# Altium project a4403-ELE-CAD.PrjPcb (part 1 of 4)
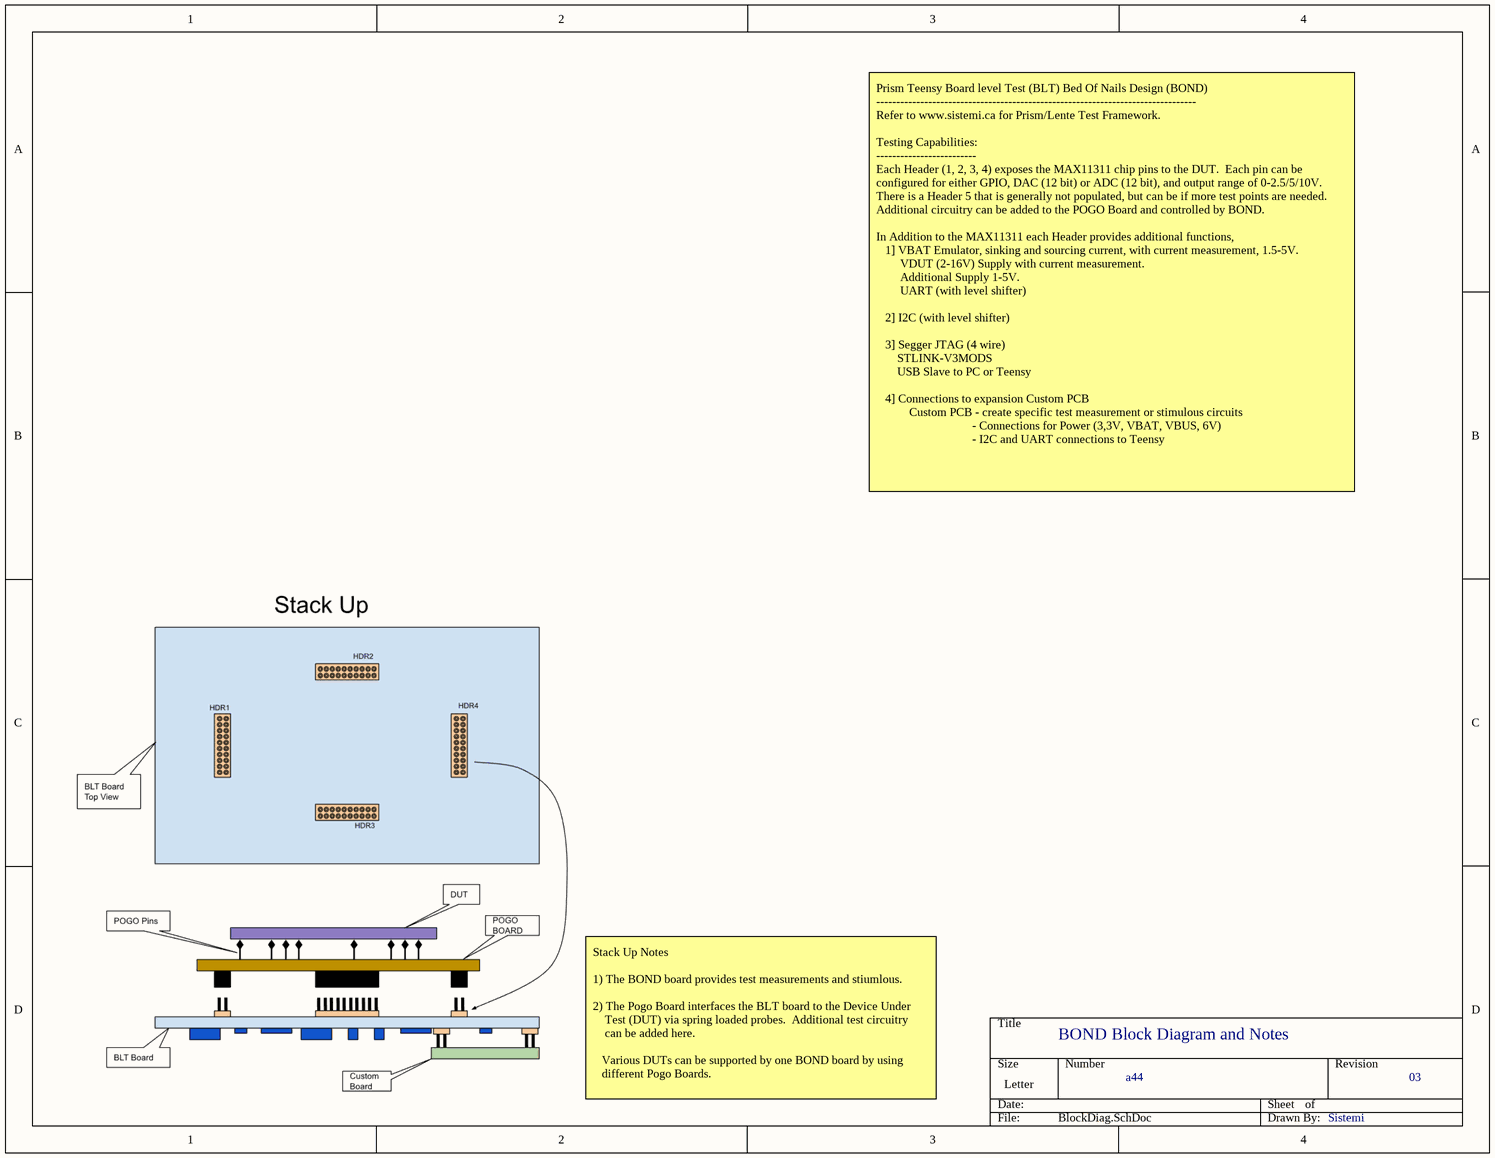
[diagram p0: BlockDiag.SchDoc]
15 sheets, 389 parts. Net scope: hierarchical (ports join the sheet entries above them; power ports are global).
Board file: a4403-ELE_PCB.PcbDoc
Sheets:
  BlockDiag.SchDoc
  Top.SchDoc
    SH2 = VBAT.SchDoc
    SH4 = Hdr1.SchDoc
    SH5 = Hdr2.SchDoc
    SH6 = Hdr3.SchDoc
      Designator = stlink.SchDoc
    SH7 = Hdr4.SchDoc
    SH8 = JigInterface.SchDoc
    SH9 = PowerDist.SchDoc
    SH10 = VDUT.SchDoc
    SH11 = Teensy4.SchDoc
    SH12 = SMPS.SchDoc
    SH13 = IOExpand.SchDoc
    SH14 = Hdr5.SchDoc

## Sheet BlockDiag.SchDoc
size Letter; SheetNumber: 1; SheetTotal: 15

### Notes on the sheet
- Prism Teensy Board level Test (BLT) Bed Of Nails Design (BOND)
  --------------------------------------------------------------------------------
  Refer to www.sistemi.ca for Prism/Lente Test Framework.
  Testing Capabilities:
  -------------------------
  Each Header (1, 2, 3, 4) exposes the MAX11311 chip pins to the DUT.  Each pin can be
  configured for either GPIO, DAC (12 bit) or ADC (12 bit), and output range of 0-2.5/5/10V.
  There is a Header 5 that is generally not populated, but can be if more test points are needed.
  Additional circuitry can be added to the POGO Board and controlled by BOND.
  In Addition to the MAX11311 each Header provides additional functions,
  1] VBAT Emulator, sinking and sourcing current, with current measurement, 1.5-5V.
  VDUT (2-16V) Supply with current measurement.
  Additional Supply 1-5V.
  UART (with level shifter)
  2] I2C (with level shifter)
  3] Segger JTAG (4 wire)
  STLINK-V3MODS
  USB Slave to PC or Teensy
  4] Connections to expansion Custom PCB
  Custom PCB - create specific test measurement or stimulous circuits
  - Connections for Power (3,3V, VBAT, VBUS, 6V)
  - I2C and UART connections to Teensy
- BOND Block Diagram and Notes
- Stack Up Notes
  1) The BOND board provides test measurements and stiumlous.
  2) The Pogo Board interfaces the BLT board to the Device Under
  Test (DUT) via spring loaded probes.  Additional test circuitry
  can be added here.
  Various DUTs can be supported by one BOND board by using
  different Pogo Boards.
- a44
- 03
- Sistemi

## Sheet Top.SchDoc
size Letter; SheetNumber: 2; SheetTotal: 15
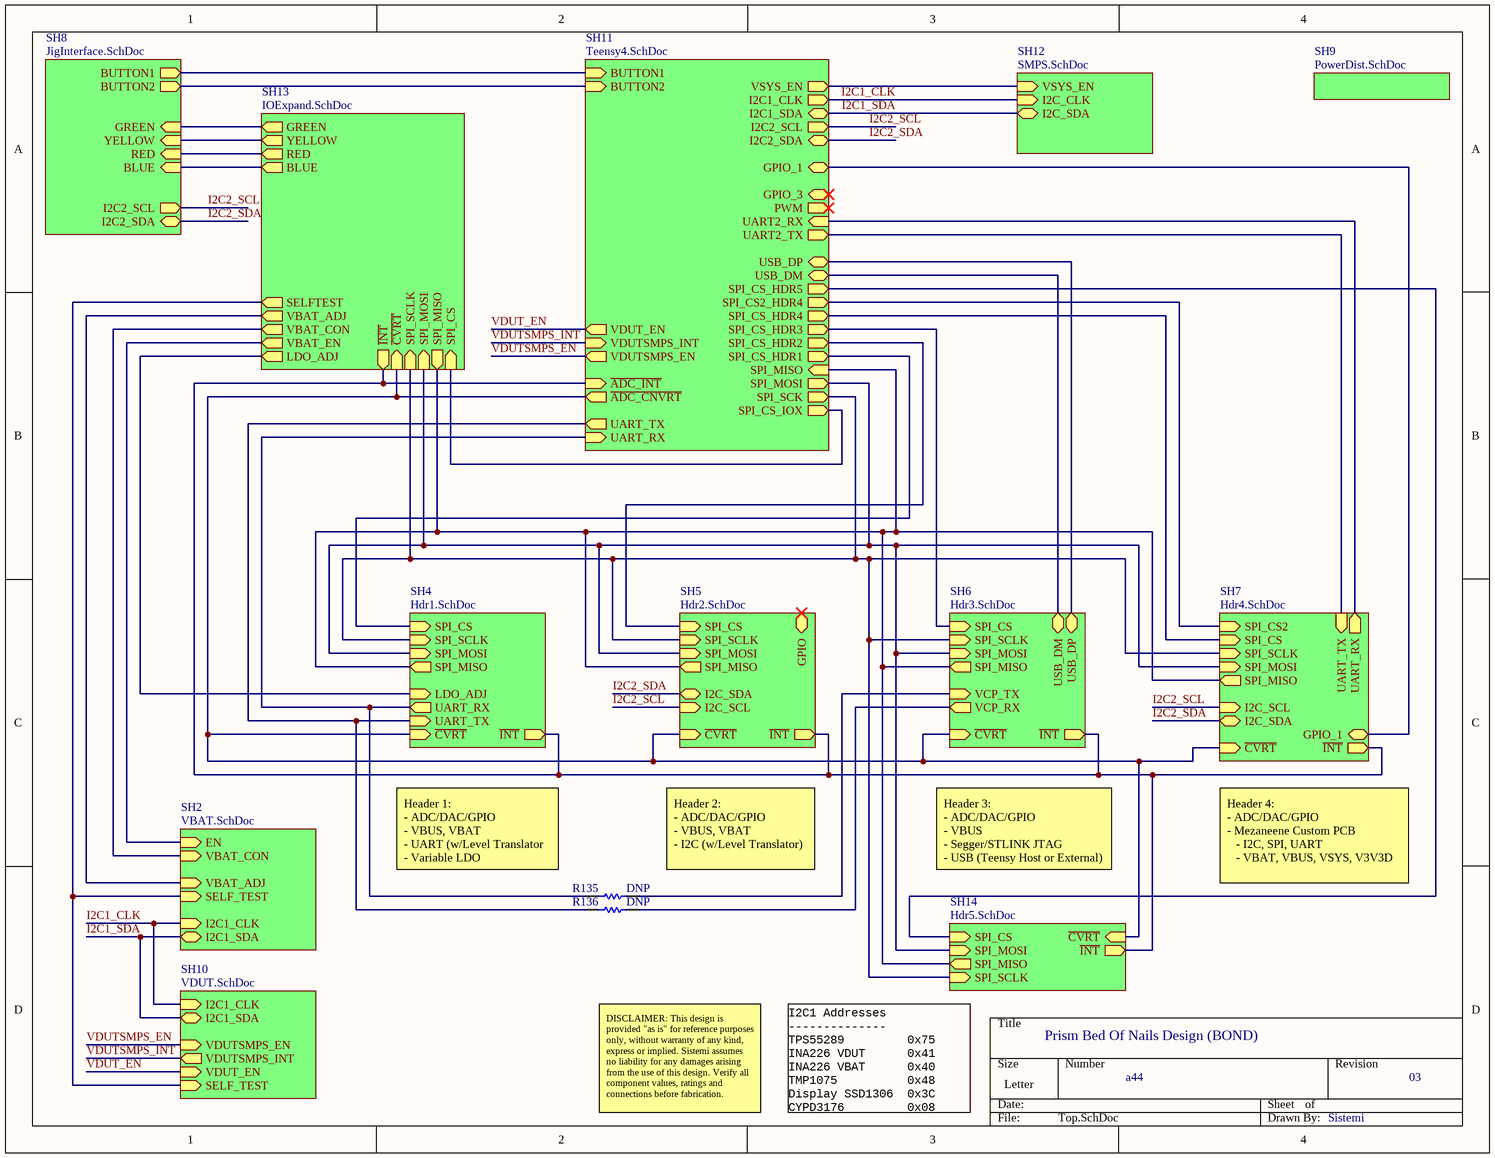
[diagram p1: Top.SchDoc]

### Parts
R135  Resistance: DNP  [RESC1005X40X25NL05T05]  (hidden comment: DNP,±1%,0402)
R136  Resistance: DNP  [RESC1005X40X25NL05T05]  (hidden comment: DNP,±1%,0402)

### Sub-sheets
SH2 = VBAT.SchDoc: I2C1_SDA (bidir), EN (in), VBAT_CON (in), SELF_TEST (in), I2C1_CLK (in), VBAT_ADJ (in)
SH4 = Hdr1.SchDoc: SPI_MOSI (in), SPI_CS (in), ~{INT} (out), SPI_MISO (out), SPI_SCLK (in), ~{CVRT} (in), UART_TX (in), UART_RX (out), LDO_ADJ (in)
SH5 = Hdr2.SchDoc: SPI_SCLK (in), SPI_MISO (out), SPI_MOSI (in), I2C_SDA (bidir), I2C_SCL (in), SPI_CS (in), ~{CVRT} (in), ~{INT} (out), GPIO (bidir)
SH6 = Hdr3.SchDoc: SPI_MOSI (in), SPI_SCLK (in), SPI_CS (in), SPI_MISO (out), ~{INT} (out), ~{CVRT} (in), USB_DP (bidir), USB_DM (bidir), VCP_TX (in), VCP_RX (out)
SH7 = Hdr4.SchDoc: ~{CVRT} (in), SPI_CS2 (in), I2C_SDA (bidir), SPI_SCLK (in), SPI_MOSI (in), SPI_CS (in), I2C_SCL (in), SPI_MISO (out), ~{INT} (out), GPIO_1 (bidir), UART_TX (in), UART_RX (out)
SH8 = JigInterface.SchDoc: BLUE (in), YELLOW (in), RED (in), BUTTON1 (out), GREEN (in), BUTTON2 (out), I2C2_SCL (out), I2C2_SDA (bidir)
SH9 = PowerDist.SchDoc: no entries
SH10 = VDUT.SchDoc: I2C1_SDA (bidir), I2C1_CLK (in), VDUTSMPS_EN (in), VDUTSMPS_INT (out), SELF_TEST (in), VDUT_EN (in)
SH11 = Teensy4.SchDoc: I2C1_CLK (out), SPI_MISO (in), SPI_CS_HDR3 (out), I2C1_SDA (bidir), SPI_SCK (out), SPI_CS_HDR4 (out), SPI_CS_HDR2 (out), SPI_CS2_HDR4 (out), ~{ADC_INT} (in), GPIO_1 (bidir), SPI_CS_HDR1 (out), I2C2_SDA (bidir), I2C2_SCL (out), ~{ADC_CNVRT} (out), SPI_MOSI (out), BUTTON1 (in), BUTTON2 (in), USB_DP (bidir), USB_DM (bidir), UART_TX (out), UART_RX (in), UART2_TX (out), UART2_RX (in), SPI_CS_IOX (out), PWM (out), GPIO_3 (bidir), VDUT_EN (out), VDUTSMPS_INT (in), VDUTSMPS_EN (out), VSYS_EN (out), SPI_CS_HDR5 (out)
SH12 = SMPS.SchDoc: VSYS_EN (in), I2C_CLK (in), I2C_SDA (bidir)
SH13 = IOExpand.SchDoc: SPI_MISO (out), RED (out), YELLOW (out), SPI_SCLK (in), VBAT_EN (out), VBAT_CON (out), ~{CVRT} (in), ~{INT} (out), BLUE (out), SPI_CS (in), SELFTEST (out), SPI_MOSI (in), GREEN (out), VBAT_ADJ (out), LDO_ADJ (out)
SH14 = Hdr5.SchDoc: SPI_CS (in), ~{CVRT} (in), ~{INT} (out), SPI_MOSI (in), SPI_MISO (out), SPI_SCLK (in)

### Nets
ADC_INT: sheet SH4/~{INT}, sheet SH5/~{INT}, sheet SH6/~{INT}, sheet SH7/~{INT}, sheet SH11/~{ADC_INT}, sheet SH13/~{INT}, sheet SH14/~{INT}
I2C1_CLK: sheet SH2/I2C1_CLK, sheet SH10/I2C1_CLK, sheet SH11/I2C1_CLK, sheet SH12/I2C_CLK
I2C1_SDA: sheet SH2/I2C1_SDA, sheet SH10/I2C1_SDA, sheet SH11/I2C1_SDA, sheet SH12/I2C_SDA
I2C2_SCL: sheet SH5/I2C_SCL, sheet SH7/I2C_SCL, sheet SH8/I2C2_SCL, sheet SH11/I2C2_SCL
I2C2_SDA: sheet SH5/I2C_SDA, sheet SH7/I2C_SDA, sheet SH8/I2C2_SDA, sheet SH11/I2C2_SDA
SPI_CS2_HDR4: sheet SH7/SPI_CS2, sheet SH11/SPI_CS2_HDR4
SPI_CS_HDR1: sheet SH4/SPI_CS, sheet SH11/SPI_CS_HDR1
SPI_CS_HDR2: sheet SH5/SPI_CS, sheet SH11/SPI_CS_HDR2
SPI_CS_HDR3: sheet SH6/SPI_CS, sheet SH11/SPI_CS_HDR3
SPI_CS_HDR4: sheet SH7/SPI_CS, sheet SH11/SPI_CS_HDR4
SPI_CS_IOX: sheet SH11/SPI_CS_IOX, sheet SH13/SPI_CS
SPI_MISO: sheet SH4/SPI_MISO, sheet SH5/SPI_MISO, sheet SH6/SPI_MISO, sheet SH7/SPI_MISO, sheet SH11/SPI_MISO, sheet SH13/SPI_MISO, sheet SH14/SPI_MISO
SPI_MOSI: sheet SH4/SPI_MOSI, sheet SH5/SPI_MOSI, sheet SH6/SPI_MOSI, sheet SH7/SPI_MOSI, sheet SH11/SPI_MOSI, sheet SH13/SPI_MOSI, sheet SH14/SPI_MOSI
SPI_SCK: sheet SH4/SPI_SCLK, sheet SH5/SPI_SCLK, sheet SH6/SPI_SCLK, sheet SH7/SPI_SCLK, sheet SH11/SPI_SCK, sheet SH13/SPI_SCLK, sheet SH14/SPI_SCLK
UART_RX: R135.2 ; sheet SH4/UART_RX, sheet SH11/UART_RX
UART_TX: R136.2 ; sheet SH4/UART_TX, sheet SH11/UART_TX
VDUT_EN: sheet SH10/VDUT_EN, sheet SH11/VDUT_EN
VDUTSMPS_EN: sheet SH10/VDUTSMPS_EN, sheet SH11/VDUTSMPS_EN
VDUTSMPS_INT: sheet SH10/VDUTSMPS_INT, sheet SH11/VDUTSMPS_INT
NetJ14_14: sheet SH7/GPIO_1, sheet SH11/GPIO_1
NetJ15_15: sheet SH7/UART_TX, sheet SH11/UART2_TX
NetJ15_17: sheet SH7/UART_RX, sheet SH11/UART2_RX
NetQ1_5: sheet SH2/SELF_TEST, sheet SH10/SELF_TEST, sheet SH13/SELFTEST
NetR28_2: sheet SH2/EN, sheet SH13/VBAT_EN
NetR36_2: sheet SH2/VBAT_ADJ, sheet SH13/VBAT_ADJ
NetR37_1: sheet SH2/VBAT_CON, sheet SH13/VBAT_CON
NetR47_2: sheet SH4/LDO_ADJ, sheet SH13/LDO_ADJ
NetR61_2: sheet SH8/GREEN, sheet SH13/GREEN
NetR62_2: sheet SH8/YELLOW, sheet SH13/YELLOW
NetR65_2: sheet SH8/RED, sheet SH13/RED
NetR66_2: sheet SH8/BLUE, sheet SH13/BLUE
NetR98_1: sheet SH6/USB_DP, sheet SH11/USB_DP
NetR100_1: sheet SH6/USB_DM, sheet SH11/USB_DM
NetR135_1: R135.1 ; sheet SH6/VCP_TX
NetR136_1: R136.1 ; sheet SH6/VCP_RX
NetR146_2: sheet SH11/VSYS_EN, sheet SH12/VSYS_EN
NetU1_7: sheet SH8/BUTTON1, sheet SH11/BUTTON1
NetU1_8: sheet SH8/BUTTON2, sheet SH11/BUTTON2
NetU1_9: sheet SH4/~{CVRT}, sheet SH5/~{CVRT}, sheet SH6/~{CVRT}, sheet SH7/~{CVRT}, sheet SH11/~{ADC_CNVRT}, sheet SH13/~{CVRT}, sheet SH14/~{CVRT}
NetU1_19: sheet SH11/SPI_CS_HDR5, sheet SH14/SPI_CS

### Notes on the sheet
- Header 1:
  - ADC/DAC/GPIO
  - VBUS, VBAT
  - UART (w/Level Translator
  - Variable LDO
- Header 2:
  - ADC/DAC/GPIO
  - VBUS, VBAT
  - I2C (w/Level Translator)
- Header 3:
  - ADC/DAC/GPIO
  - VBUS
  - Segger/STLINK JTAG
  - USB (Teensy Host or External)
- Header 4:
  - ADC/DAC/GPIO
  - Mezaneene Custom PCB
  - I2C, SPI, UART
  - VBAT, VBUS, VSYS, V3V3D
- Prism Bed Of Nails Design (BOND)
- DISCLAIMER: This design is provided "as is" for reference purposes only, without warranty of any kind, express or implied. Sistemi assumes no liability for any damages arising from the use of this design. Verify all component values, ratings and connections before fabrication.
- I2C1 Addresses
  --------------
  TPS55289         0x75
  INA226 VDUT      0x41
  INA226 VBAT      0x40
  TMP1075          0x48
  Display SSD1306  0x3C
  CYPD3176         0x08
- a44
- 03
- Sistemi

### Library data of the parts
R135 R136 = CMP-3902036-3: Generic RES 0402, =Resistance+','+Tolerance+','+Case; Lead-Free Status: Lead Free; Voltage: 50.0 V; Power: 0.063 W; Mounting Style: Surface Mount; RoHS: Compliant; Number of Pins: 2; Tolerance: ±1%; Octopart Url: TBD; Case: 0402; OctopartID: 26dced8948c2f91b

## Sheet VBAT.SchDoc
size Letter; SheetNumber: 5; SheetTotal: 15
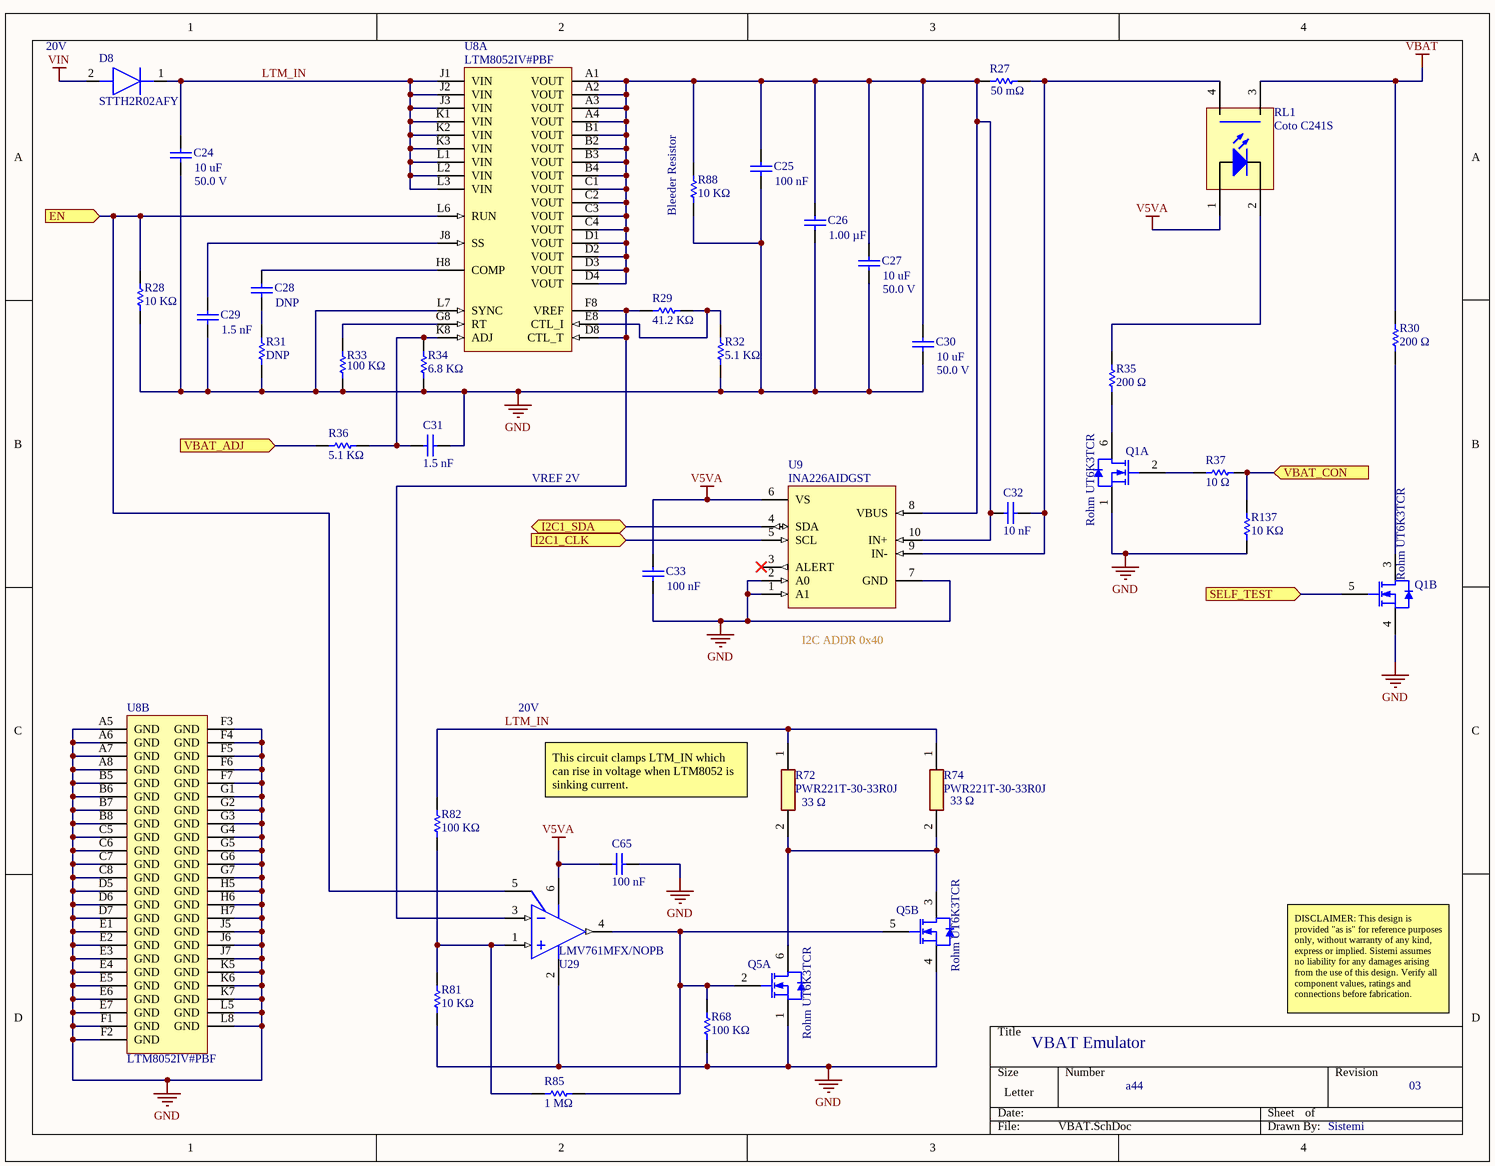
[diagram p2: VBAT.SchDoc]

### Parts
C24  Capacitance: 10 uF  Voltage Rating (DC): 50.0 V  [CAPC3216X180X55LL20T25]  (hidden comment: Murata GRM31CR61H106KA12L)
C25  Capacitance: 100 nF  [CAPC1005X56X25NL10T15]  (hidden comment: Samsung CL05B104KO5NNNC)
C26  Capacitance: 1.00 µF  [CAPC1608X90X35NL15T15]  (hidden comment: Samsung CL10B105KA8NNNC)
C27  Capacitance: 10 uF  Voltage Rating (DC): 50.0 V  [CAPC3216X180X55LL20T25]  (hidden comment: Murata GRM31CR61H106KA12L)
C28  Capacitance: DNP  [CAPC1608X90X35ML15T15]  (hidden comment: Generic CAP 0603)
C29  Capacitance: 1.5 nF  [CAPC1608X90X35ML15T15]  (hidden comment: Generic CAP 0603)
C30  Capacitance: 10 uF  Voltage Rating (DC): 50.0 V  [CAPC3216X180X55LL20T25]  (hidden comment: Murata GRM31CR61H106KA12L)
C31  Capacitance: 1.5 nF  [CAPC1608X90X35ML15T15]  (hidden comment: Generic CAP 0603)
C32  Capacitance: 10 nF  [CAPC1005X56X25NL10T15]  (hidden comment: 10 nF,±10%,25V,CGO,0402)
C33  Capacitance: 100 nF  [CAPC1005X56X25NL10T15]  (hidden comment: Samsung CL05B104KO5NNNC)
C65  Capacitance: 100 nF  [CAPC1005X56X25NL10T15]  (hidden comment: Samsung CL05B104KO5NNNC)
D8  STTH2R02AFY  [SODFL4724X103N]
Q1  Rohm UT6K3TCR  [DFN2020-8D]  (parts A,B of 2)
Q5  Rohm UT6K3TCR  [DFN2020-8D]  (parts A,B of 2)
R27  Resistance: 50 mΩ  [RESC1608X55X30ML15T15]  (hidden comment: Generic RES 0603)
R28  Resistance: 10 KΩ  [RESC1608X55X30ML15T15]  (hidden comment: Generic RES 0603)
R29  Resistance: 41.2 KΩ  [RESC1608X55X30LL15T15]  (hidden comment: Generic RES 0603)
R30  Resistance: 200 Ω  [RESC1608X55X30ML15T15]  (hidden comment: Generic RES 0603)
R31  Resistance: DNP  [RESC1608X55X30ML15T15]  (hidden comment: Generic RES 0603)
R32  Resistance: 5.1 KΩ  [RESC1608X55X30ML15T15]  (hidden comment: Generic RES 0603)
R33  Resistance: 100 KΩ  [RESC1005X40X25NL05T05]  (hidden comment: 100 KΩ,±1%,0402)
R34  Resistance: 6.8 KΩ  [RESC1608X55X30ML15T15]  (hidden comment: Generic RES 0603)
R35  Resistance: 200 Ω  [RESC1608X55X30ML15T15]  (hidden comment: Generic RES 0603)
R36  Resistance: 5.1 KΩ  [RESC1608X55X30ML15T15]  (hidden comment: Generic RES 0603)
R37  Resistance: 10 Ω  [RESC1005X40X25NL05T05]  (hidden comment: 10 Ω,±1%,0402)
R68  Resistance: 100 KΩ  [RESC1005X40X25NL05T05]  (hidden comment: 100 KΩ,±1%,0402)
R72  PWR221T-30-33R0J  Resistance: 33 Ω  [PWR221T3033R0J]
R74  PWR221T-30-33R0J  Resistance: 33 Ω  [PWR221T3033R0J]
R81  Resistance: 10 KΩ  [RESC1608X55X30LL15T15]  (hidden comment: Generic RES 0603)
R82  Resistance: 100 KΩ  [RESC1005X40X25NL05T05]  (hidden comment: 100 KΩ,±1%,0402)
R85  Resistance: 1 MΩ  [RESC1005X40X25NL05T05]  (hidden comment: 1 MΩ,±1%,0402)
R88  Resistance: 10 KΩ  [RESC1608X55X30LL15T15]  (hidden comment: Generic RES 0603)
R137  Resistance: 10 KΩ  [RESC1608X55X30LL15T15]  (hidden comment: Generic RES 0603)
RL1  Coto C241S  [PCB-o1m8470la7x8r6xoffbd-1]
U8  LTM8052IV#PBF  [LT-LGA-81-15000X11250X2820_V]  (parts A,B of 2)
U9  INA226AIDGST  [TSSOP10]
U29  LMV761MFX/NOPB  [MF06A_N]

### Ports
EN (in), I2C1_CLK (in), I2C1_SDA (bidir), SELF_TEST (in), VBAT_ADJ (in), VBAT_CON (in)

### Nets
3: Q1.8(D) Q5.8(D)
6: Q1.7(D) Q5.7(D)
GND: C24.1 C25.1 C26.1 C27.1 C29.1 C30.1 C31.1 C33.1 C65.1 Q1.1(S) Q1.4(S) Q5.1(S) Q5.4(S) R28.1 R31.2 R32.1 R33.1 R34.1 R68.2 R81.1 R88.1 R137.1 U8.A5(GND) U8.A6(GND) U8.A7(GND) U8.A8(GND) U8.B5(GND) U8.B6(GND) U8.B7(GND) U8.B8(GND) U8.C5(GND) U8.C6(GND) U8.C7(GND) U8.C8(GND) U8.D5(GND) U8.D6(GND) U8.D7(GND) U8.E1(GND) U8.E2(GND) U8.E3(GND) U8.E4(GND) U8.E5(GND) U8.E6(GND) U8.E7(GND) U8.F1(GND) U8.F2(GND) U8.F3(GND) U8.F4(GND) U8.F5(GND) U8.F6(GND) U8.F7(GND) U8.G1(GND) U8.G2(GND) U8.G3(GND) U8.G4(GND) U8.G5(GND) U8.G6(GND) U8.G7(GND) U8.H5(GND) U8.H6(GND) U8.H7(GND) U8.J5(GND) U8.J6(GND) U8.J7(GND) U8.K5(GND) U8.K6(GND) U8.K7(GND) U8.L5(GND) U8.L7(SYNC) U8.L8(GND) U9.1(A1) U9.2(A0) U9.7(GND) U29.2(V-)
V5VA: C33.2 C65.2 RL1.1(A) U9.6(VS) U29.6(V+)
VBAT: R30.2 RL1.3(S)
VIN: D8.2(A)
I2C1_CLK: U9.5(SCL) ; port I2C1_CLK
I2C1_SDA: U9.4(SDA) ; port I2C1_SDA
LTM_IN: C24.2 D8.1(K) R72.1 R74.1 R82.1 U8.J1(VIN) U8.J2(VIN) U8.J3(VIN) U8.K1(VIN) U8.K2(VIN) U8.K3(VIN) U8.L1(VIN) U8.L2(VIN) U8.L3(VIN)
NetC25_2: C25.2 C26.2 C27.2 C30.2 C32.2 R27.1 R88.2 U8.A1(VOUT) U8.A2(VOUT) U8.A3(VOUT) U8.A4(VOUT) U8.B1(VOUT) U8.B2(VOUT) U8.B3(VOUT) U8.B4(VOUT) U8.C1(VOUT) U8.C2(VOUT) U8.C3(VOUT) U8.C4(VOUT) U8.D1(VOUT) U8.D2(VOUT) U8.D3(VOUT) U8.D4(VOUT) U9.8(VBUS) U9.10(IN+)
NetC28_1: C28.1 R31.1
NetC28_2: C28.2 U8.H8(COMP)
NetC29_2: C29.2 U8.J8(SS)
NetC31_2: C31.2 R34.2 R36.1 U8.K8(ADJ)
NetC32_1: C32.1 R27.2 RL1.4(D) U9.9(IN-)
NetQ1_2: Q1.2(G) R37.2
NetQ1_3: Q1.3(D) R30.1
NetQ1_5: Q1.5(G) ; port SELF_TEST
NetQ1_6: Q1.6(D) R35.1
NetQ5_2: Q5.2(G) Q5.5(G) R68.1 R85.1 U29.4(OUT)
NetQ5_3: Q5.3(D) Q5.6(D) R72.2 R74.2
NetR28_2: R28.2 U8.L6(RUN) U29.5(~{SD}) ; port EN
NetR29_1: R29.1 R32.2 U8.E8(CTL_I)
NetR29_2: R29.2 U8.D8(CTL_T) U8.F8(VREF) U29.3(IN-)
NetR33_2: R33.2 U8.G8(RT)
NetR35_2: R35.2 RL1.2(K)
NetR36_2: R36.2 ; port VBAT_ADJ
NetR37_1: R37.1 R137.2 ; port VBAT_CON
NetR81_2: R81.2 R82.2 R85.2 U29.1(IN+)

Not connected (* = marked no-connect by the designer): U9 3(ALERT)*

### Notes on the sheet
- (near D8) 20V
- (near R88) Bleeder Resistor
- VREF 2V
- (near U9) I2C ADDR 0x40
- 20V
- (near R72) This circuit clamps LTM_IN which can rise in voltage when LTM8052 is sinking current.
- VBAT Emulator
- DISCLAIMER: This design is provided "as is" for reference purposes only, without warranty of any kind, express or implied. Sistemi assumes no liability for any damages arising from the use of this design. Verify all component values, ratings and connections before fabrication.
- a44
- 03
- Sistemi

### Library data of the parts
C24 C27 C30 = CMP-3554908-2: Multilayer Ceramic Capacitors MLCC - SMD/SMT 1206 10uF 50volt X5R +/-10%; Manufacturer Part Number: CL31B106KBHNNNE; Capacitance Tolerance: ±10%; Case/Package (SI): 3216; Lead-Free Status: Lead Free; Dielectric Characteristic: X5R; Lifecycle Status: Active; Mounting Style: Surface Mount; Number of Pins: 2; Octopart Url: https://octopart.com/grm31cr61h106ka12l-murata-18903335; OctopartID: fd8535afa9c42242; Packaging: Cut Tape (CT); REACH SVHC Compliance: No SVHC; RoHS: Compliant; Size-Length: 0.0032 m; Size-Thickness: 0.0016 m; Size-Width: 0.0016 m
C25 C33 C65 = CMP-bf2276a55d9a60e5-19: Ceramic capacitor SMD-0402 100nF /16V X7R# K +-10%, Samsung, RoHS; Dielectric Characteristic: X7R; Lead-Free Status: Lead Free; Voltage Rating (DC): 16.0 V; Capacitance Tolerance: ±10%; Mounting Style: Surface Mount; Case/Package: 0402; OctopartID: 0755ced2c795d892; Footprint: PCB-0002-00476-3; Octopart URL: https://octopart.com/cl05b104ko5nnnc-samsung-9299366; RoHS: Compliant; Manufacturer Part Number: CL05B104KO5NNNC
C26 = CMP-7473528-5: CL Series 0603 1 uF 25 V ±10 % X7R Surface Mount Multilayer Ceramic Capacitor; Manufacturer Part Number: UMK107AB7105KA-T; Lead-Free Status: Lead Free; Capacitance Tolerance: ±10%; Voltage Rating (DC): 25.0 V; RoHS: Compliant; Mounting Style: Surface Mount; Footprint: PCB-0002-00062-3; Octopart URL: http://octopart.com/cl10b105ka8nnnc-samsung-19831597; Case/Package: 0603; OctopartID: ce7a065e703111bd; Dielectric Characteristic: X7R
C28 = CMP-7473528-7: Generic CAP 0603, =Capacitance+','+Tolerance+','+Voltage+','+Dielectric; Manufacturer Part Number: TBD; Voltage: 25V; Dielectric: X7R; Tolerance: ±10%; Lead-Free Status: Lead Free; RoHS: Compliant; Footprint: PCB-0002-00062-3; OctopartID: ce7a065e703111bd; Mounting Style: Surface Mount; Octopart URL: TBD; Case: 0603
C29 C31 = CMP-7473528-7: Generic CAP 0603, =Capacitance+','+Tolerance+','+Voltage+','+Dielectric; Manufacturer Part Number: GRM1885C2A152JA01D; Voltage: 25V; Dielectric: X7R; Tolerance: ±10%; Lead-Free Status: Lead Free; RoHS: Compliant; Footprint: PCB-0002-00062-3; OctopartID: ce7a065e703111bd; Mounting Style: Surface Mount; Octopart URL: TBD; Case: 0603
C32 = CMP-bf2276a55d9a60e5-20: Generic CAP 0402, =Capacitance+','+Tolerance+','+Voltage+','+Dielectric+','+Case; Manufacturer Part Number: GRM1555C1E103JE01J; Lead-Free Status: Lead Free; Octopart URL: TBD; Case: 0402; OctopartID: 0755ced2c795d892; Voltage: 25V; Dielectric: CGO; RoHS: Compliant; Mounting Style: Surface Mount; Tolerance: ±10%; Footprint: PCB-0002-00476-3
D8 = STTH2R02AFY: Diode; Manufacturer_Name: STMicroelectronics; Datasheet Link: https://www.st.com/resource/en/datasheet/stth2r02af-y.pdf; Height: 1.03mm; Manufacturer Part Number: STTH2R02AFY; Mouser Part Number: 511-STTH2R02AFY; Mouser Price/Stock: https://www.mouser.co.uk/ProductDetail/STMicroelectronics/STTH2R02AFY?qs=pZIKbki37pqpUMRfOtxSog%3D%3D; Arrow Part Number: STTH2R02AFY; Arrow Price/Stock: https://www.arrow.com/en/products/stth2r02afy/stmicroelectronics
Q1 Q5 = CMP-7da2b0d499b7a265-2: On a Reel of 3000, Dual N-Channel MOSFET, 5.5 A, 30 V, 8-Pin DFN ROHM UT6K3TCR; Polarity: Dual N-Channel; Footprint: PCB-qj1nrqbgj5udp5r3frdj-1; RoHS: Compliant; OctopartID: 7da2b0d499b7a265; Manufacturer Part Number: UT6K3TCR; Operating Temperature: 150 °C (max); Octopart URL: https://octopart.com/ut6k3tcr-rohm-75284851
R27 = CMP-0800c38b3cf2d7c7-3: Generic RES 0603, =Resistance+','+Tolerance+','+Case; Manufacturer Part Number: WSLP0603R0500FEB; Case/Package (SI): 1608; Lead-Free Status: Lead Free; Power Rating: 63.0 mW; Voltage: 50V; ELV Compliant: Compliant; Tolerance: ±1%; Temperature Coefficient: -50.0 ppm/°C to 50.0 ppm/°C; Octopart URL: TBD; Number of Pins: 2; Mounting Style: Surface Mount; Packaging: Tape & Reel (TR); Lifecycle Status: Active; RoHS: Compliant; Case: 0603; Operating Temperature: -55.0 °C to 125 °C; REACH SVHC Compliance: No SVHC; Footprint: PCB-0002-00066-3; OctopartID: a8e96364fc37772e
R28 R81 R88 R137 = CMP-0800c38b3cf2d7c7-3: Generic RES 0603, =Resistance+','+Tolerance+','+Case; Manufacturer Part Number: MCT06030C1002FP500; Case/Package (SI): 1608; Lead-Free Status: Lead Free; Power Rating: 63.0 mW; Voltage: 50V; ELV Compliant: Compliant; Tolerance: ±1%; Temperature Coefficient: -50.0 ppm/°C to 50.0 ppm/°C; Octopart URL: TBD; Number of Pins: 2; Mounting Style: Surface Mount; Packaging: Tape & Reel (TR); Lifecycle Status: Active; RoHS: Compliant; Case: 0603; Operating Temperature: -55.0 °C to 125 °C; REACH SVHC Compliance: No SVHC; Footprint: PCB-0002-00066-3; OctopartID: a8e96364fc37772e
R29 = CMP-0800c38b3cf2d7c7-3: Generic RES 0603, =Resistance+','+Tolerance+','+Case; Manufacturer Part Number: RT0603BRE0741K2L; Case/Package (SI): 1608; Lead-Free Status: Lead Free; Power Rating: 63.0 mW; Voltage: 50V; ELV Compliant: Compliant; Tolerance: ±1%; Temperature Coefficient: -50.0 ppm/°C to 50.0 ppm/°C; Octopart URL: TBD; Number of Pins: 2; Mounting Style: Surface Mount; Packaging: Tape & Reel (TR); Lifecycle Status: Active; RoHS: Compliant; Case: 0603; Operating Temperature: -55.0 °C to 125 °C; REACH SVHC Compliance: No SVHC; Footprint: PCB-0002-00066-3; OctopartID: a8e96364fc37772e
R30 R35 = CMP-0800c38b3cf2d7c7-3: Generic RES 0603, =Resistance+','+Tolerance+','+Case; Manufacturer Part Number: RT0603FRE10200RL; Case/Package (SI): 1608; Lead-Free Status: Lead Free; Power Rating: 63.0 mW; Voltage: 50V; ELV Compliant: Compliant; Tolerance: ±1%; Temperature Coefficient: -50.0 ppm/°C to 50.0 ppm/°C; Octopart URL: TBD; Number of Pins: 2; Mounting Style: Surface Mount; Packaging: Tape & Reel (TR); Lifecycle Status: Active; RoHS: Compliant; Case: 0603; Operating Temperature: -55.0 °C to 125 °C; REACH SVHC Compliance: No SVHC; Footprint: PCB-0002-00066-3; OctopartID: a8e96364fc37772e
R31 = CMP-0800c38b3cf2d7c7-3: Generic RES 0603, =Resistance+','+Tolerance+','+Case; Manufacturer Part Number: TBD; Case/Package (SI): 1608; Lead-Free Status: Lead Free; Power Rating: 63.0 mW; Voltage: 50V; ELV Compliant: Compliant; Tolerance: ±1%; Temperature Coefficient: -50.0 ppm/°C to 50.0 ppm/°C; Octopart URL: TBD; Number of Pins: 2; Mounting Style: Surface Mount; Packaging: Tape & Reel (TR); Lifecycle Status: Active; RoHS: Compliant; Case: 0603; Operating Temperature: -55.0 °C to 125 °C; REACH SVHC Compliance: No SVHC; Footprint: PCB-0002-00066-3; OctopartID: a8e96364fc37772e
R32 R36 = CMP-0800c38b3cf2d7c7-3: Generic RES 0603, =Resistance+','+Tolerance+','+Case; Manufacturer Part Number: RT0603FRE075K1L; Case/Package (SI): 1608; Lead-Free Status: Lead Free; Power Rating: 63.0 mW; Voltage: 50V; ELV Compliant: Compliant; Tolerance: ±1%; Temperature Coefficient: -50.0 ppm/°C to 50.0 ppm/°C; Octopart URL: TBD; Number of Pins: 2; Mounting Style: Surface Mount; Packaging: Tape & Reel (TR); Lifecycle Status: Active; RoHS: Compliant; Case: 0603; Operating Temperature: -55.0 °C to 125 °C; REACH SVHC Compliance: No SVHC; Footprint: PCB-0002-00066-3; OctopartID: a8e96364fc37772e
R33 R68 R82 = CMP-3902036-3: Generic RES 0402, =Resistance+','+Tolerance+','+Case; Manufacturer Part Number: RT0402FRE07100KL; Lead-Free Status: Lead Free; Voltage: 50.0 V; Power: 0.063 W; Mounting Style: Surface Mount; RoHS: Compliant; Number of Pins: 2; Tolerance: ±1%; Octopart Url: TBD; Case: 0402; OctopartID: 26dced8948c2f91b
R34 = CMP-0800c38b3cf2d7c7-3: Generic RES 0603, =Resistance+','+Tolerance+','+Case; Manufacturer Part Number: RT0603FRE076K8L; Case/Package (SI): 1608; Lead-Free Status: Lead Free; Power Rating: 63.0 mW; Voltage: 50V; ELV Compliant: Compliant; Tolerance: ±1%; Temperature Coefficient: -50.0 ppm/°C to 50.0 ppm/°C; Octopart URL: TBD; Number of Pins: 2; Mounting Style: Surface Mount; Packaging: Tape & Reel (TR); Lifecycle Status: Active; RoHS: Compliant; Case: 0603; Operating Temperature: -55.0 °C to 125 °C; REACH SVHC Compliance: No SVHC; Footprint: PCB-0002-00066-3; OctopartID: a8e96364fc37772e
R37 = CMP-3902036-3: Generic RES 0402, =Resistance+','+Tolerance+','+Case; Manufacturer Part Number: RT0402FRE0710RL; Lead-Free Status: Lead Free; Voltage: 50.0 V; Power: 0.063 W; Mounting Style: Surface Mount; RoHS: Compliant; Number of Pins: 2; Tolerance: ±1%; Octopart Url: TBD; Case: 0402; OctopartID: 26dced8948c2f91b
R72 R74 = PWR221T-30-33R0J: Resistor; Manufacturer_Name: Bourns; Datasheet Link: https://www.bourns.com/docs/Product-Datasheets/pwr221t-30.pdf; Height: 19.3mm; Manufacturer Part Number: PWR221T-30-33R0J; Mouser Part Number: 652-PWR221T-30-33R0J; Mouser Price/Stock: https://www.mouser.com/Search/Refine.aspx?Keyword=652-PWR221T-30-33R0J
R85 = CMP-3902036-3: as R135 on sheet Top; Mounting Style: Surface Mount; RoHS: Compliant; Number of Pins: 2; Tolerance: ±1%; Octopart Url: TBD; Case: 0402; OctopartID: 26dced8948c2f91b
RL1 = CMP-147564696-2: Coto Mosfet - 1 Form A, 5A, 20V Max/ Tape-Reel; OctopartID: 147564696; Manufacturer Part Number: C241S; Octopart Url: https://octopart.com/c241s-coto-147564696
U8 = CMP-1600243-2: 36 VIN, 5 A, 2-Quadrant CVCC Step-Down uModule Regulator, 81-pin LGA, -40 to 125 degC, Pb-Free, Tray; Number of Outputs: 1; Output Current: 5.0 A; Output Voltage: 24.0 V; Manufacturer Part Number: LTM8052IV#PBF; Mounting Style: Surface Mount; Number of Pins: 81; Octopart Url: https://octopart.com/ltm8052iv%23pbf-linear+technology-21041704; OctopartID: cd35057efa7b12f2; Packaging: Cut Tape (CT); REACH SVHC Compliance: No SVHC; RoHS: Compliant
U9 = CMP-947c5c4360184bbb-17: 36-V, Bi-Directional, Ultra-High Accuracy, Low-/High-Side, I2C Out Current/Power Monitor w/ Alert 10-VSSOP -40 to 125; Manufacturer Part Number: INA226AIDGST
U29 = CMP-1345124-4: Low Voltage, Precision Comparator with Push-Pull Output, 6-pin SOT-23, Pb-Free; Manufacturer: Texas Instruments; Output Current: 0.04 A; Number of Channels: 1; Lead-Free Status: Lead Free; RoHS: Compliant; OctopartID: 23bbebcbaf88fc7c; Case/Package: SOT; Mounting Style: Surface Mount; Octopart Url: https://octopart.com/lmv761mfx%2Fnopb-texas+instruments-24815957; DigiKey: https://www.digikey.com/en/products/detail/texas-instruments/LMV761MFX-NOPB/1872382; Lifecycle Status: Active; Manufacturer Part Number: LMV761MFX/NOPB

## Sheet Hdr1.SchDoc
size Letter; SheetNumber: 8; SheetTotal: 15
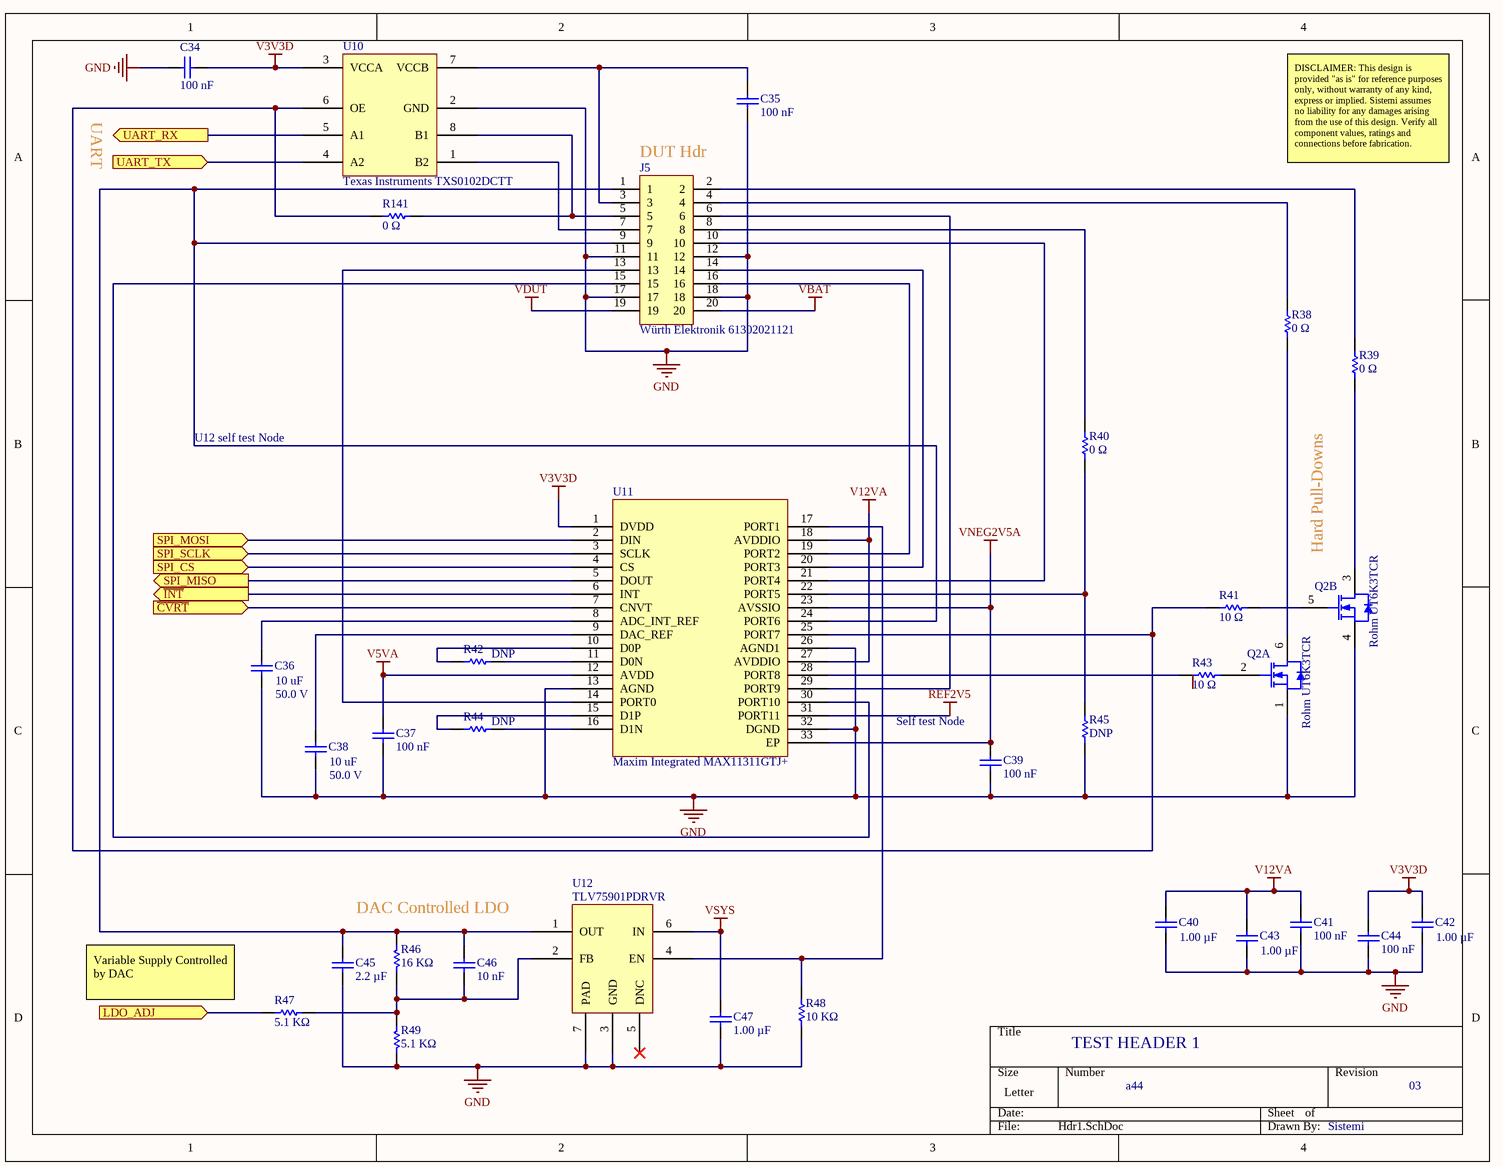
[diagram p3: Hdr1.SchDoc]

### Parts
C34  Capacitance: 100 nF  [CAPC1005X56X25NL10T15]  (hidden comment: Samsung CL05B104KO5NNNC)
C35  Capacitance: 100 nF  [CAPC1005X56X25NL10T15]  (hidden comment: Samsung CL05B104KO5NNNC)
C36  Capacitance: 10 uF  Voltage Rating (DC): 50.0 V  [CAPC3216X180X55LL20T25]  (hidden comment: Murata GRM31CR61H106KA12L)
C37  Capacitance: 100 nF  [CAPC1005X56X25NL10T15]  (hidden comment: Samsung CL05B104KO5NNNC)
C38  Capacitance: 10 uF  Voltage Rating (DC): 50.0 V  [CAPC3216X180X55LL20T25]  (hidden comment: Murata GRM31CR61H106KA12L)
C39  Capacitance: 100 nF  [CAPC1005X56X25NL10T15]  (hidden comment: Samsung CL05B104KO5NNNC)
C40  Capacitance: 1.00 µF  [CAPC1608X90X35NL15T15]  (hidden comment: Samsung CL10B105KA8NNNC)
C41  Capacitance: 100 nF  [CAPC1005X56X25NL10T15]  (hidden comment: Samsung CL05B104KO5NNNC)
C42  Capacitance: 1.00 µF  [CAPC1608X90X35NL15T15]  (hidden comment: Samsung CL10B105KA8NNNC)
C43  Capacitance: 1.00 µF  [CAPC1608X90X35NL15T15]  (hidden comment: Samsung CL10B105KA8NNNC)
C44  Capacitance: 100 nF  [CAPC1005X56X25NL10T15]  (hidden comment: Samsung CL05B104KO5NNNC)
C45  Capacitance: 2.2 µF  [CAPC1608X90X35NL15T15]  (hidden comment: 2.2 µF,±10%,25V,X7R,0603)
C46  Capacitance: 10 nF  [CAPC1005X56X25NL10T15]  (hidden comment: 10 nF,±10%,25V,CGO,0402)
C47  Capacitance: 1.00 µF  [CAPC1608X90X35NL15T15]  (hidden comment: Samsung CL10B105KA8NNNC)
J5  Würth Elektronik 61302021121  [PCB-nk6cd1c3p7lqby8wsdwb-1]
Q2  Rohm UT6K3TCR  [DFN2020-8D]  (parts A,B of 2)
R38  Resistance: 0 Ω  [RESC1608X55X30ML15T15]  (hidden comment: Generic RES 0603)
R39  Resistance: 0 Ω  [RESC1608X55X30ML15T15]  (hidden comment: Generic RES 0603)
R40  Resistance: 0 Ω  [RESC1608X55X30ML15T15]  (hidden comment: Generic RES 0603)
R41  Resistance: 10 Ω  [RESC1005X40X25NL05T05]  (hidden comment: 10 Ω,±1%,0402)
R42  Resistance: DNP  [RESC1608X55X30ML15T15]  (hidden comment: Generic RES 0603)
R43  Resistance: 10 Ω  [RESC1005X40X25NL05T05]  (hidden comment: 10 Ω,±1%,0402)
R44  Resistance: DNP  [RESC1608X55X30ML15T15]  (hidden comment: Generic RES 0603)
R45  Resistance: DNP  [RESC1608X55X30ML15T15]  (hidden comment: Generic RES 0603)
R46  Resistance: 16 KΩ  [RESC1608X55X30ML15T15]  (hidden comment: Generic RES 0603)
R47  Resistance: 5.1 KΩ  [RESC1608X55X30ML15T15]  (hidden comment: Generic RES 0603)
R48  Resistance: 10 KΩ  [RESC1608X55X30ML15T15]  (hidden comment: Generic RES 0603)
R49  Resistance: 5.1 KΩ  [RESC1608X55X30ML15T15]  (hidden comment: Generic RES 0603)
R141  Resistance: 0 Ω  [RESC1608X55X30ML15T15]  (hidden comment: Generic RES 0603)
U10  Texas Instruments TXS0102DCTT  [PCB-19361507-1]
U11  Maxim Integrated MAX11311GTJ+  [PCB-s1hzzxkmij8s4b201del-1]
U12  TLV75901PDRVR  [PCB-ude52gq66msu1251nhm5-1]

### Ports
LDO_ADJ (in), SPI_CS (in), SPI_MISO (out), SPI_MOSI (in), SPI_SCLK (in), UART_RX (out), UART_TX (in), ~{CVRT} (in), ~{INT} (out)

### Nets
3: Q2.8(D)
6: Q2.7(D)
GND: C34.1 C35.2 C36.1 C37.2 C38.1 C39.2 C40.1 C41.2 C42.1 C43.1 C44.2 C45.1 C47.1 J5.11 J5.12 J5.17 J5.18 Q2.1(S) Q2.4(S) R45.1 R48.1 R49.1 U10.2(GND) U11.13(AGND) U11.26(AGND1) U11.32(DGND) U12.3(GND) U12.7(PAD)
REF2V5: U11.31(PORT11)
V3V3D: C34.2 C42.2 C44.1 U10.3(VCCA) U11.1(DVDD)
V5VA: C37.1 U11.12(AVDD)
V12VA: C40.2 C41.1 C43.2 U11.18(AVDDIO) U11.27(AVDDIO)
VBAT: J5.20
VDUT: J5.19
VNEG2V5A: C39.1 U11.23(AVSSIO) U11.33(EP)
VSYS: C47.2 U12.6(IN)
ADC_INT: U11.6(INT) ; port ~{INT}
SPI_CS_HDR1: U11.4(CS) ; port SPI_CS
SPI_MISO: U11.5(DOUT) ; port SPI_MISO
SPI_MOSI: U11.2(DIN) ; port SPI_MOSI
SPI_SCK: U11.3(SCLK) ; port SPI_SCLK
UART_RX: U10.5(A1) ; port UART_RX
UART_TX: U10.4(A2) ; port UART_TX
NetC35_1: C35.1 J5.3 U10.7(VCCB)
NetC36_2: C36.2 U11.8(ADC_INT_REF)
NetC38_2: C38.2 U11.9(DAC_REF)
NetC45_2: C45.2 C46.2 J5.1 J5.9 R46.2 U11.24(PORT6) U12.1(OUT)
NetC46_1: C46.1 R46.1 R47.1 R49.2 U12.2(FB)
NetJ5_2: J5.2 R39.2
NetJ5_4: J5.4 R38.2
NetJ5_5: J5.5 R141.1 U10.8(B1)
NetJ5_6: J5.6 U11.29(PORT9)
NetJ5_7: J5.7 U10.1(B2)
NetJ5_8: J5.8 R40.2
NetJ5_10: J5.10 U11.21(PORT4)
NetJ5_13: J5.13 U11.14(PORT0)
NetJ5_14: J5.14 U11.20(PORT3)
NetJ5_15: J5.15 U11.30(PORT10)
NetJ5_16: J5.16 U11.19(PORT2)
NetQ2_2: Q2.2(G) R43.1
NetQ2_3: Q2.3(D) R39.1
NetQ2_5: Q2.5(G) R41.1
NetQ2_6: Q2.6(D) R38.1
NetR40_1: R40.1 R45.2 U11.22(PORT5)
NetR41_2: R41.2 R141.2 U10.6(OE) U11.25(PORT7)
NetR42_1: R42.1 U11.11(D0N)
NetR42_2: R42.2 U11.10(D0P)
NetR43_2: R43.2 U11.28(PORT8)
NetR44_1: R44.1 U11.16(D1N)
NetR44_2: R44.2 U11.15(D1P)
NetR47_2: R47.2 ; port LDO_ADJ
NetR48_2: R48.2 U11.17(PORT1) U12.4(EN)
NetU1_9: U11.7(CNVT) ; port ~{CVRT}

Not connected (* = marked no-connect by the designer): U12 5(DNC)*

### Notes on the sheet
- UART
- (near J5) DUT Hdr
- DISCLAIMER: This design is provided "as is" for reference purposes only, without warranty of any kind, express or implied. Sistemi assumes no liability for any damages arising from the use of this design. Verify all component values, ratings and connections before fabrication.
- U12 self test Node
- Hard Pull-Downs
- (near C39) Self test Node
- DAC Controlled LDO
- (near R47) Variable Supply Controlled
  by DAC
- TEST HEADER 1
- a44
- 03
- Sistemi

### Library data of the parts
C34 C35 C37 C39 C41 C44 = CMP-bf2276a55d9a60e5-19: as C25 on sheet VBAT; Mounting Style: Surface Mount; Case/Package: 0402; OctopartID: 0755ced2c795d892; Footprint: PCB-0002-00476-3; Octopart URL: https://octopart.com/cl05b104ko5nnnc-samsung-9299366; RoHS: Compliant; Manufacturer Part Number: CL05B104KO5NNNC
C36 C38 = CMP-3554908-2: as C24 on sheet VBAT; Dielectric Characteristic: X5R; Lifecycle Status: Active; Mounting Style: Surface Mount; Number of Pins: 2; Octopart Url: https://octopart.com/grm31cr61h106ka12l-murata-18903335; OctopartID: fd8535afa9c42242; Packaging: Cut Tape (CT); REACH SVHC Compliance: No SVHC; RoHS: Compliant; Size-Length: 0.0032 m; Size-Thickness: 0.0016 m; Size-Width: 0.0016 m
C40 C42 C43 C47 = CMP-7473528-5: as C26 on sheet VBAT; RoHS: Compliant; Mounting Style: Surface Mount; Footprint: PCB-0002-00062-3; Octopart URL: http://octopart.com/cl10b105ka8nnnc-samsung-19831597; Case/Package: 0603; OctopartID: ce7a065e703111bd; Dielectric Characteristic: X7R
C45 = CMP-7473528-7: Generic CAP 0603, =Capacitance+','+Tolerance+','+Voltage+','+Dielectric; Manufacturer Part Number: GRM188Z71E225KE43D; Lead-Free Status: Lead Free; RoHS: Compliant; Voltage: 25V; Footprint: PCB-0002-00062-3; Dielectric: X7R; Tolerance: ±10%; OctopartID: ce7a065e703111bd; Mounting Style: Surface Mount; Octopart URL: TBD; Case: 0603
C46 = CMP-bf2276a55d9a60e5-20: as C32 on sheet VBAT; Octopart URL: TBD; Case: 0402; OctopartID: 0755ced2c795d892; Voltage: 25V; Dielectric: CGO; RoHS: Compliant; Mounting Style: Surface Mount; Tolerance: ±10%; Footprint: PCB-0002-00476-3
J5 = CMP-005cc8a3733edf9b-7: THT Vertical Pin Header WR-PHD, Pitch 2.54 mm, Dual Row, 20 pins; Current Rating: 3.00 A; Dielectric Withstanding Voltage: 500 V; Pin Pitch: 2.54 mm; Operating Voltage: 250 V; Number of Contacts: 20; Contact Resistance: 20.0 mΩ; Gender: Male; Contact Material: Copper; Footprint: PCB-005cc8a3733edf9b-1; Mounting Style: Through Hole; Color: Black; Contact Plating: Gold; REACH SVHC Compliance: No SVHC; RoHS: Compliant; Octopart URL: https://octopart.com/61302021121-w%C3%BCrth+elektronik-32855556; Packaging: Bag; Orientation: Vertical; OctopartID: 005cc8a3733edf9b; Number of Pins: 20; Operating Temperature: -40.0 °C (min); Manufacturer Part Number: 61302021121
Q2 = CMP-7da2b0d499b7a265-2: as Q1 on sheet VBAT; Polarity: Dual N-Channel; Footprint: PCB-qj1nrqbgj5udp5r3frdj-1; RoHS: Compliant; OctopartID: 7da2b0d499b7a265; Manufacturer Part Number: UT6K3TCR; Operating Temperature: 150 °C (max); Octopart URL: https://octopart.com/ut6k3tcr-rohm-75284851
R38-R40 R141 = CMP-0800c38b3cf2d7c7-3: Generic RES 0603, =Resistance+','+Tolerance+','+Case; Manufacturer Part Number: CRCW06030000Z0EAC; Case/Package (SI): 1608; Lead-Free Status: Lead Free; Power Rating: 63.0 mW; Voltage: 50V; ELV Compliant: Compliant; Tolerance: ±1%; Temperature Coefficient: -50.0 ppm/°C to 50.0 ppm/°C; Octopart URL: TBD; Number of Pins: 2; Mounting Style: Surface Mount; Packaging: Tape & Reel (TR); Lifecycle Status: Active; RoHS: Compliant; Case: 0603; Operating Temperature: -55.0 °C to 125 °C; REACH SVHC Compliance: No SVHC; Footprint: PCB-0002-00066-3; OctopartID: a8e96364fc37772e
R41 R43 = CMP-3902036-3: as R37 on sheet VBAT; Mounting Style: Surface Mount; RoHS: Compliant; Number of Pins: 2; Tolerance: ±1%; Octopart Url: TBD; Case: 0402; OctopartID: 26dced8948c2f91b
R42 R44 R45 = CMP-0800c38b3cf2d7c7-3: as R31 on sheet VBAT; Octopart URL: TBD; Number of Pins: 2; Mounting Style: Surface Mount; Packaging: Tape & Reel (TR); Lifecycle Status: Active; RoHS: Compliant; Case: 0603; Operating Temperature: -55.0 °C to 125 °C; REACH SVHC Compliance: No SVHC; Footprint: PCB-0002-00066-3; OctopartID: a8e96364fc37772e
R46 = CMP-0800c38b3cf2d7c7-3: Generic RES 0603, =Resistance+','+Tolerance+','+Case; Manufacturer Part Number: MCT06030C1602FP500; Case/Package (SI): 1608; Lead-Free Status: Lead Free; Power Rating: 63.0 mW; Voltage: 50V; ELV Compliant: Compliant; Tolerance: ±1%; Temperature Coefficient: -50.0 ppm/°C to 50.0 ppm/°C; Octopart URL: TBD; Number of Pins: 2; Mounting Style: Surface Mount; Packaging: Tape & Reel (TR); Lifecycle Status: Active; RoHS: Compliant; Case: 0603; Operating Temperature: -55.0 °C to 125 °C; REACH SVHC Compliance: No SVHC; Footprint: PCB-0002-00066-3; OctopartID: a8e96364fc37772e
R47 R49 = CMP-0800c38b3cf2d7c7-3: as R32 on sheet VBAT; Octopart URL: TBD; Number of Pins: 2; Mounting Style: Surface Mount; Packaging: Tape & Reel (TR); Lifecycle Status: Active; RoHS: Compliant; Case: 0603; Operating Temperature: -55.0 °C to 125 °C; REACH SVHC Compliance: No SVHC; Footprint: PCB-0002-00066-3; OctopartID: a8e96364fc37772e
R48 = CMP-0800c38b3cf2d7c7-3: as R28 on sheet VBAT; Octopart URL: TBD; Number of Pins: 2; Mounting Style: Surface Mount; Packaging: Tape & Reel (TR); Lifecycle Status: Active; RoHS: Compliant; Case: 0603; Operating Temperature: -55.0 °C to 125 °C; REACH SVHC Compliance: No SVHC; Footprint: PCB-0002-00066-3; OctopartID: a8e96364fc37772e
U10 = CMP-19361507-3: Voltage Level Translator 2-CH Bidirectional 8-Pin SSOP T/R; Number of Bits: 2; Output Current: 1.00 mA; Supply Voltage (DC): 3.60 V (max), 1.65 V (min); Lead-Free Status: Lead Free; Octopart URL: https://octopart.com/txs0102dctt-texas+instruments-7512181; Lifecycle Status: Active; Operating Temperature: -40.0 °C to 85.0 °C; Packaging: Cut Tape (CT), Tape & Reel (TR); OctopartID: bfd576ad3ac66012; RoHS: Compliant; REACH SVHC Compliance: No SVHC; Manufacturer Part Number: TXS0102DCTT; Case/Package: SSOP; Number of Pins: 8
U11 = CMP-2cd8e1e00624f31f-4: 12-channel 12-Bit ADC and 12-Bit DAC, Analog PIXI, 12-Port Programmable Mixed-Signal I/O; Channels: 12; Lead-Free Status: Lead Free; Sample Rate: 400 kHz; Range Options: 0 to 2.5V, ±5V, 0 to +10V, -10V; Supply Voltage (DC): 4.75 V (max), 5.25 V (min); Manufacturer Part Number: MAX11311GTJ+; Lifecycle Status: Not Listed by Manufacturer; Octopart URL: http://octopart.com/max11311gtj%2B-maxim+integrated-70389658; RoHS: Compliant; Number of Bits: 12; OctopartID: 2cd8e1e00624f31f; Package: TQFN-32; Resolution: 12-bit
U12 = CMP-2b7ce7b2db7ff4bb-4: LDO Regulator Pos 0.55V to 5.5V 1A 6-Pin WSON EP T/R; Dropout Voltage: 190 mV; Number of Regulated Outputs: 1; Output Capacitor Type: Ceramic; Quiescent Current: 25.0 µA; OctopartID: 2b7ce7b2db7ff4bb; Manufacturer Part Number: TLV75901PDRVR; Footprint: PCB-6kp9dl1mk9yrlugndkjx-1; RoHS: Compliant; Octopart URL: https://octopart.com/tlv75901pdrvr-texas+instruments-96785765; Number of Pins: 6; Lifecycle Status: Pre-Release; Case/Package: WSON; Operating Temperature: -40.0 °C to 125 °C

## Sheet Hdr2.SchDoc
size Letter; SheetNumber: 9; SheetTotal: 15
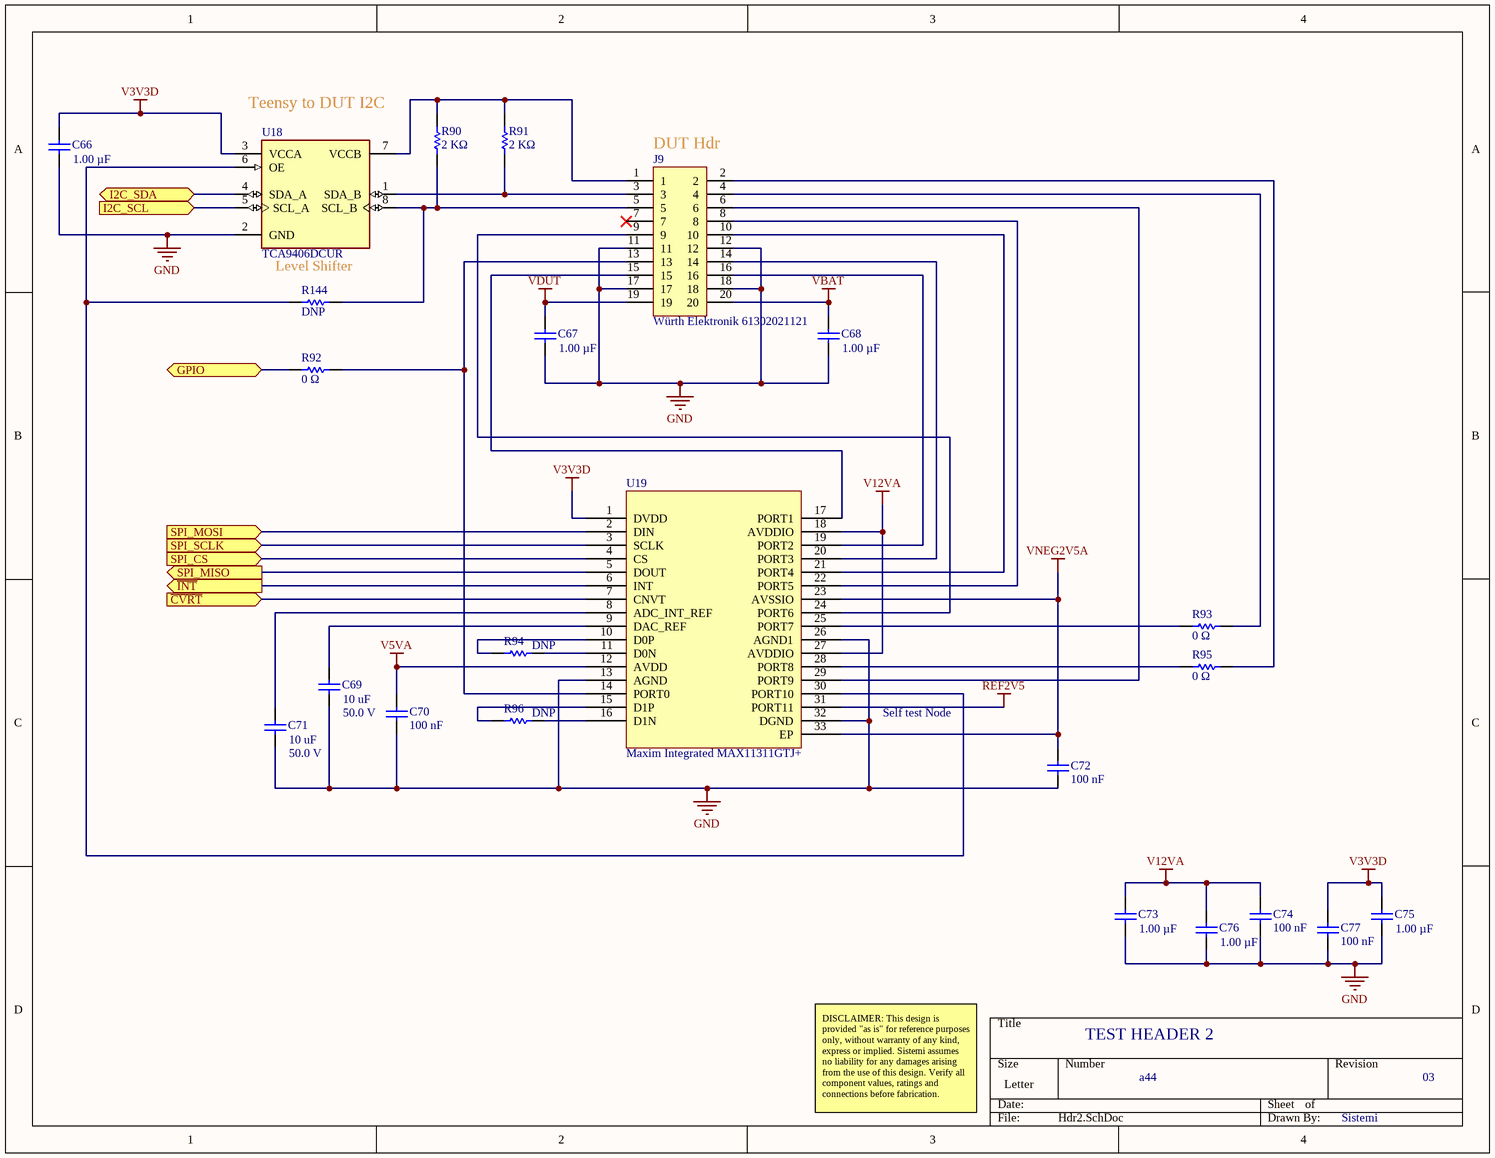
[diagram p4: Hdr2.SchDoc]

### Parts
C66  Capacitance: 1.00 µF  [CAPC1608X90X35NL15T15]  (hidden comment: Samsung CL10B105KA8NNNC)
C67  Capacitance: 1.00 µF  [CAPC1608X90X35NL15T15]  (hidden comment: Samsung CL10B105KA8NNNC)
C68  Capacitance: 1.00 µF  [CAPC1608X90X35NL15T15]  (hidden comment: Samsung CL10B105KA8NNNC)
C69  Capacitance: 10 uF  Voltage Rating (DC): 50.0 V  [CAPC3216X180X55LL20T25]  (hidden comment: Murata GRM31CR61H106KA12L)
C70  Capacitance: 100 nF  [CAPC1005X56X25NL10T15]  (hidden comment: Samsung CL05B104KO5NNNC)
C71  Capacitance: 10 uF  Voltage Rating (DC): 50.0 V  [CAPC3216X180X55LL20T25]  (hidden comment: Murata GRM31CR61H106KA12L)
C72  Capacitance: 100 nF  [CAPC1005X56X25NL10T15]  (hidden comment: Samsung CL05B104KO5NNNC)
C73  Capacitance: 1.00 µF  [CAPC1608X90X35NL15T15]  (hidden comment: Samsung CL10B105KA8NNNC)
C74  Capacitance: 100 nF  [CAPC1005X56X25NL10T15]  (hidden comment: Samsung CL05B104KO5NNNC)
C75  Capacitance: 1.00 µF  [CAPC1608X90X35NL15T15]  (hidden comment: Samsung CL10B105KA8NNNC)
C76  Capacitance: 1.00 µF  [CAPC1608X90X35NL15T15]  (hidden comment: Samsung CL10B105KA8NNNC)
C77  Capacitance: 100 nF  [CAPC1005X56X25NL10T15]  (hidden comment: Samsung CL05B104KO5NNNC)
J9  Würth Elektronik 61302021121  [PCB-nk6cd1c3p7lqby8wsdwb-1]
R90  Resistance: 2 KΩ  [RESC1608X55X30ML15T15]  (hidden comment: Generic RES 0603)
R91  Resistance: 2 KΩ  [RESC1608X55X30ML15T15]  (hidden comment: Generic RES 0603)
R92  Resistance: 0 Ω  [RESC1608X55X30ML15T15]  (hidden comment: Generic RES 0603)
R93  Resistance: 0 Ω  [RESC1608X55X30ML15T15]  (hidden comment: Generic RES 0603)
R94  Resistance: DNP  [RESC1608X55X30ML15T15]  (hidden comment: Generic RES 0603)
R95  Resistance: 0 Ω  [RESC1608X55X30ML15T15]  (hidden comment: Generic RES 0603)
R96  Resistance: DNP  [RESC1608X55X30ML15T15]  (hidden comment: Generic RES 0603)
R144  Resistance: DNP  [RESC1608X55X30ML15T15]  (hidden comment: Generic RES 0603)
U18  TCA9406DCUR  [DCU8_L]
U19  Maxim Integrated MAX11311GTJ+  [PCB-s1hzzxkmij8s4b201del-1]

### Ports
GPIO (bidir), I2C_SCL (in), I2C_SDA (bidir), SPI_CS (in), SPI_MISO (out), SPI_MOSI (in), SPI_SCLK (in), ~{CVRT} (in), ~{INT} (out)

### Nets
GND: C66.1 C67.1 C68.1 C69.1 C70.2 C71.1 C72.2 C73.1 C74.2 C75.1 C76.1 C77.2 J9.11 J9.12 J9.17 J9.18 U18.2(GND) U19.13(AGND) U19.26(AGND1) U19.32(DGND)
REF2V5: U19.31(PORT11)
V3V3D: C66.2 C75.2 C77.1 U18.3(VCCA) U19.1(DVDD)
V5VA: C70.1 U19.12(AVDD)
V12VA: C73.2 C74.1 C76.2 U19.18(AVDDIO) U19.27(AVDDIO)
VBAT: C68.2 J9.20
VDUT: C67.2 J9.19
VNEG2V5A: C72.1 U19.23(AVSSIO) U19.33(EP)
ADC_INT: U19.6(INT) ; port ~{INT}
I2C2_SCL: U18.5(SCL_A) ; port I2C_SCL
I2C2_SDA: U18.4(SDA_A) ; port I2C_SDA
SPI_CS_HDR2: U19.4(CS) ; port SPI_CS
SPI_MISO: U19.5(DOUT) ; port SPI_MISO
SPI_MOSI: U19.2(DIN) ; port SPI_MOSI
SPI_SCK: U19.3(SCLK) ; port SPI_SCLK
NetC69_2: C69.2 U19.9(DAC_REF)
NetC71_2: C71.2 U19.8(ADC_INT_REF)
NetJ9_1: J9.1 R90.1 R91.1 U18.7(VCCB)
NetJ9_2: J9.2 R95.1
NetJ9_3: J9.3 R91.2 U18.1(SDA_B)
NetJ9_4: J9.4 R93.1
NetJ9_5: J9.5 R90.2 R144.1 U18.8(SCL_B)
NetJ9_6: J9.6 U19.29(PORT9)
NetJ9_8: J9.8 U19.22(PORT5)
NetJ9_9: J9.9 U19.24(PORT6)
NetJ9_10: J9.10 U19.21(PORT4)
NetJ9_13: J9.13 R92.1 U19.14(PORT0)
NetJ9_14: J9.14 U19.20(PORT3)
NetJ9_15: J9.15 U19.17(PORT1)
NetJ9_16: J9.16 U19.19(PORT2)
NetR92_2: R92.2 ; port GPIO
NetR93_2: R93.2 U19.25(PORT7)
NetR94_1: R94.1 U19.11(D0N)
NetR94_2: R94.2 U19.10(D0P)
NetR95_2: R95.2 U19.28(PORT8)
NetR96_1: R96.1 U19.16(D1N)
NetR96_2: R96.2 U19.15(D1P)
NetR144_2: R144.2 U18.6(OE) U19.30(PORT10)
NetU1_9: U19.7(CNVT) ; port ~{CVRT}

Not connected (* = marked no-connect by the designer): J9 7*

### Notes on the sheet
- Teensy to DUT I2C
- (near J9) DUT Hdr
- Level Shifter
- Self test Node
- TEST HEADER 2
- DISCLAIMER: This design is provided "as is" for reference purposes only, without warranty of any kind, express or implied. Sistemi assumes no liability for any damages arising from the use of this design. Verify all component values, ratings and connections before fabrication.
- a44
- 03
- Sistemi

### Library data of the parts
C66-C68 C73 C75 C76 = CMP-7473528-5: as C26 on sheet VBAT; RoHS: Compliant; Mounting Style: Surface Mount; Footprint: PCB-0002-00062-3; Octopart URL: http://octopart.com/cl10b105ka8nnnc-samsung-19831597; Case/Package: 0603; OctopartID: ce7a065e703111bd; Dielectric Characteristic: X7R
C69 C71 = CMP-3554908-2: as C24 on sheet VBAT; Dielectric Characteristic: X5R; Lifecycle Status: Active; Mounting Style: Surface Mount; Number of Pins: 2; Octopart Url: https://octopart.com/grm31cr61h106ka12l-murata-18903335; OctopartID: fd8535afa9c42242; Packaging: Cut Tape (CT); REACH SVHC Compliance: No SVHC; RoHS: Compliant; Size-Length: 0.0032 m; Size-Thickness: 0.0016 m; Size-Width: 0.0016 m
C70 C72 C74 C77 = CMP-bf2276a55d9a60e5-19: as C25 on sheet VBAT; Mounting Style: Surface Mount; Case/Package: 0402; OctopartID: 0755ced2c795d892; Footprint: PCB-0002-00476-3; Octopart URL: https://octopart.com/cl05b104ko5nnnc-samsung-9299366; RoHS: Compliant; Manufacturer Part Number: CL05B104KO5NNNC
J9 = CMP-005cc8a3733edf9b-7: as J5 on sheet Hdr1; Contact Material: Copper; Footprint: PCB-005cc8a3733edf9b-1; Mounting Style: Through Hole; Color: Black; Contact Plating: Gold; REACH SVHC Compliance: No SVHC; RoHS: Compliant; Octopart URL: https://octopart.com/61302021121-w%C3%BCrth+elektronik-32855556; Packaging: Bag; Orientation: Vertical; OctopartID: 005cc8a3733edf9b; Number of Pins: 20; Operating Temperature: -40.0 °C (min); Manufacturer Part Number: 61302021121
R90 R91 = CMP-0800c38b3cf2d7c7-3: Generic RES 0603, =Resistance+','+Tolerance+','+Case; Manufacturer Part Number: RE0603FRE072KL; Case/Package (SI): 1608; Lead-Free Status: Lead Free; Power Rating: 63.0 mW; Voltage: 50V; ELV Compliant: Compliant; Tolerance: ±1%; Temperature Coefficient: -50.0 ppm/°C to 50.0 ppm/°C; Octopart URL: TBD; Number of Pins: 2; Mounting Style: Surface Mount; Packaging: Tape & Reel (TR); Lifecycle Status: Active; RoHS: Compliant; Case: 0603; Operating Temperature: -55.0 °C to 125 °C; REACH SVHC Compliance: No SVHC; Footprint: PCB-0002-00066-3; OctopartID: a8e96364fc37772e
R92 R93 R95 = CMP-0800c38b3cf2d7c7-3: as R38 on sheet Hdr1; Octopart URL: TBD; Number of Pins: 2; Mounting Style: Surface Mount; Packaging: Tape & Reel (TR); Lifecycle Status: Active; RoHS: Compliant; Case: 0603; Operating Temperature: -55.0 °C to 125 °C; REACH SVHC Compliance: No SVHC; Footprint: PCB-0002-00066-3; OctopartID: a8e96364fc37772e
R94 R96 = CMP-0800c38b3cf2d7c7-3: as R31 on sheet VBAT; Octopart URL: TBD; Number of Pins: 2; Mounting Style: Surface Mount; Packaging: Tape & Reel (TR); Lifecycle Status: Active; RoHS: Compliant; Case: 0603; Operating Temperature: -55.0 °C to 125 °C; REACH SVHC Compliance: No SVHC; Footprint: PCB-0002-00066-3; OctopartID: a8e96364fc37772e
R144 = CMP-0800c38b3cf2d7c7-3: Generic RES 0603, =Resistance+','+Tolerance+','+Case; Case/Package (SI): 1608; Lead-Free Status: Lead Free; Power Rating: 63.0 mW; Voltage: 50V; ELV Compliant: Compliant; Tolerance: ±1%; Temperature Coefficient: -50.0 ppm/°C to 50.0 ppm/°C; Octopart URL: TBD; Number of Pins: 2; Mounting Style: Surface Mount; Packaging: Tape & Reel (TR); Lifecycle Status: Active; RoHS: Compliant; Case: 0603; Operating Temperature: -55.0 °C to 125 °C; REACH SVHC Compliance: No SVHC; Footprint: PCB-0002-00066-3; OctopartID: a8e96364fc37772e
U18 = CMP-1164468-4: TCA9406 Dual Bidirectional 1-MHz I2C-BUS and SMBus Voltage Level-Translator, 1.65 to 3.6 V, -40 to 85 degC, 8-pin US8 (DCU), Green (RoHS & no Sb/Br); Lead-Free Status: Lead Free; Number of Outputs: 2; Manufacturer Part Number: TCA9406DCUR; Packaging: Cut Tape (CT); Lifecycle Status: Active; OctopartID: 2214ea378f96fdd3; REACH SVHC Compliance: No SVHC; Octopart Url: https://octopart.com/tca9406dcur-texas+instruments-19499236; RoHS: Compliant; Number of Pins: 8
U19 = CMP-2cd8e1e00624f31f-4: as U11 on sheet Hdr1; Manufacturer Part Number: MAX11311GTJ+; Lifecycle Status: Not Listed by Manufacturer; Octopart URL: http://octopart.com/max11311gtj%2B-maxim+integrated-70389658; RoHS: Compliant; Number of Bits: 12; OctopartID: 2cd8e1e00624f31f; Package: TQFN-32; Resolution: 12-bit